# Altium schematic sheet 13_eMMC_Flash.SchDoc
size A3; SheetNumber: 10; SheetTotal: 21
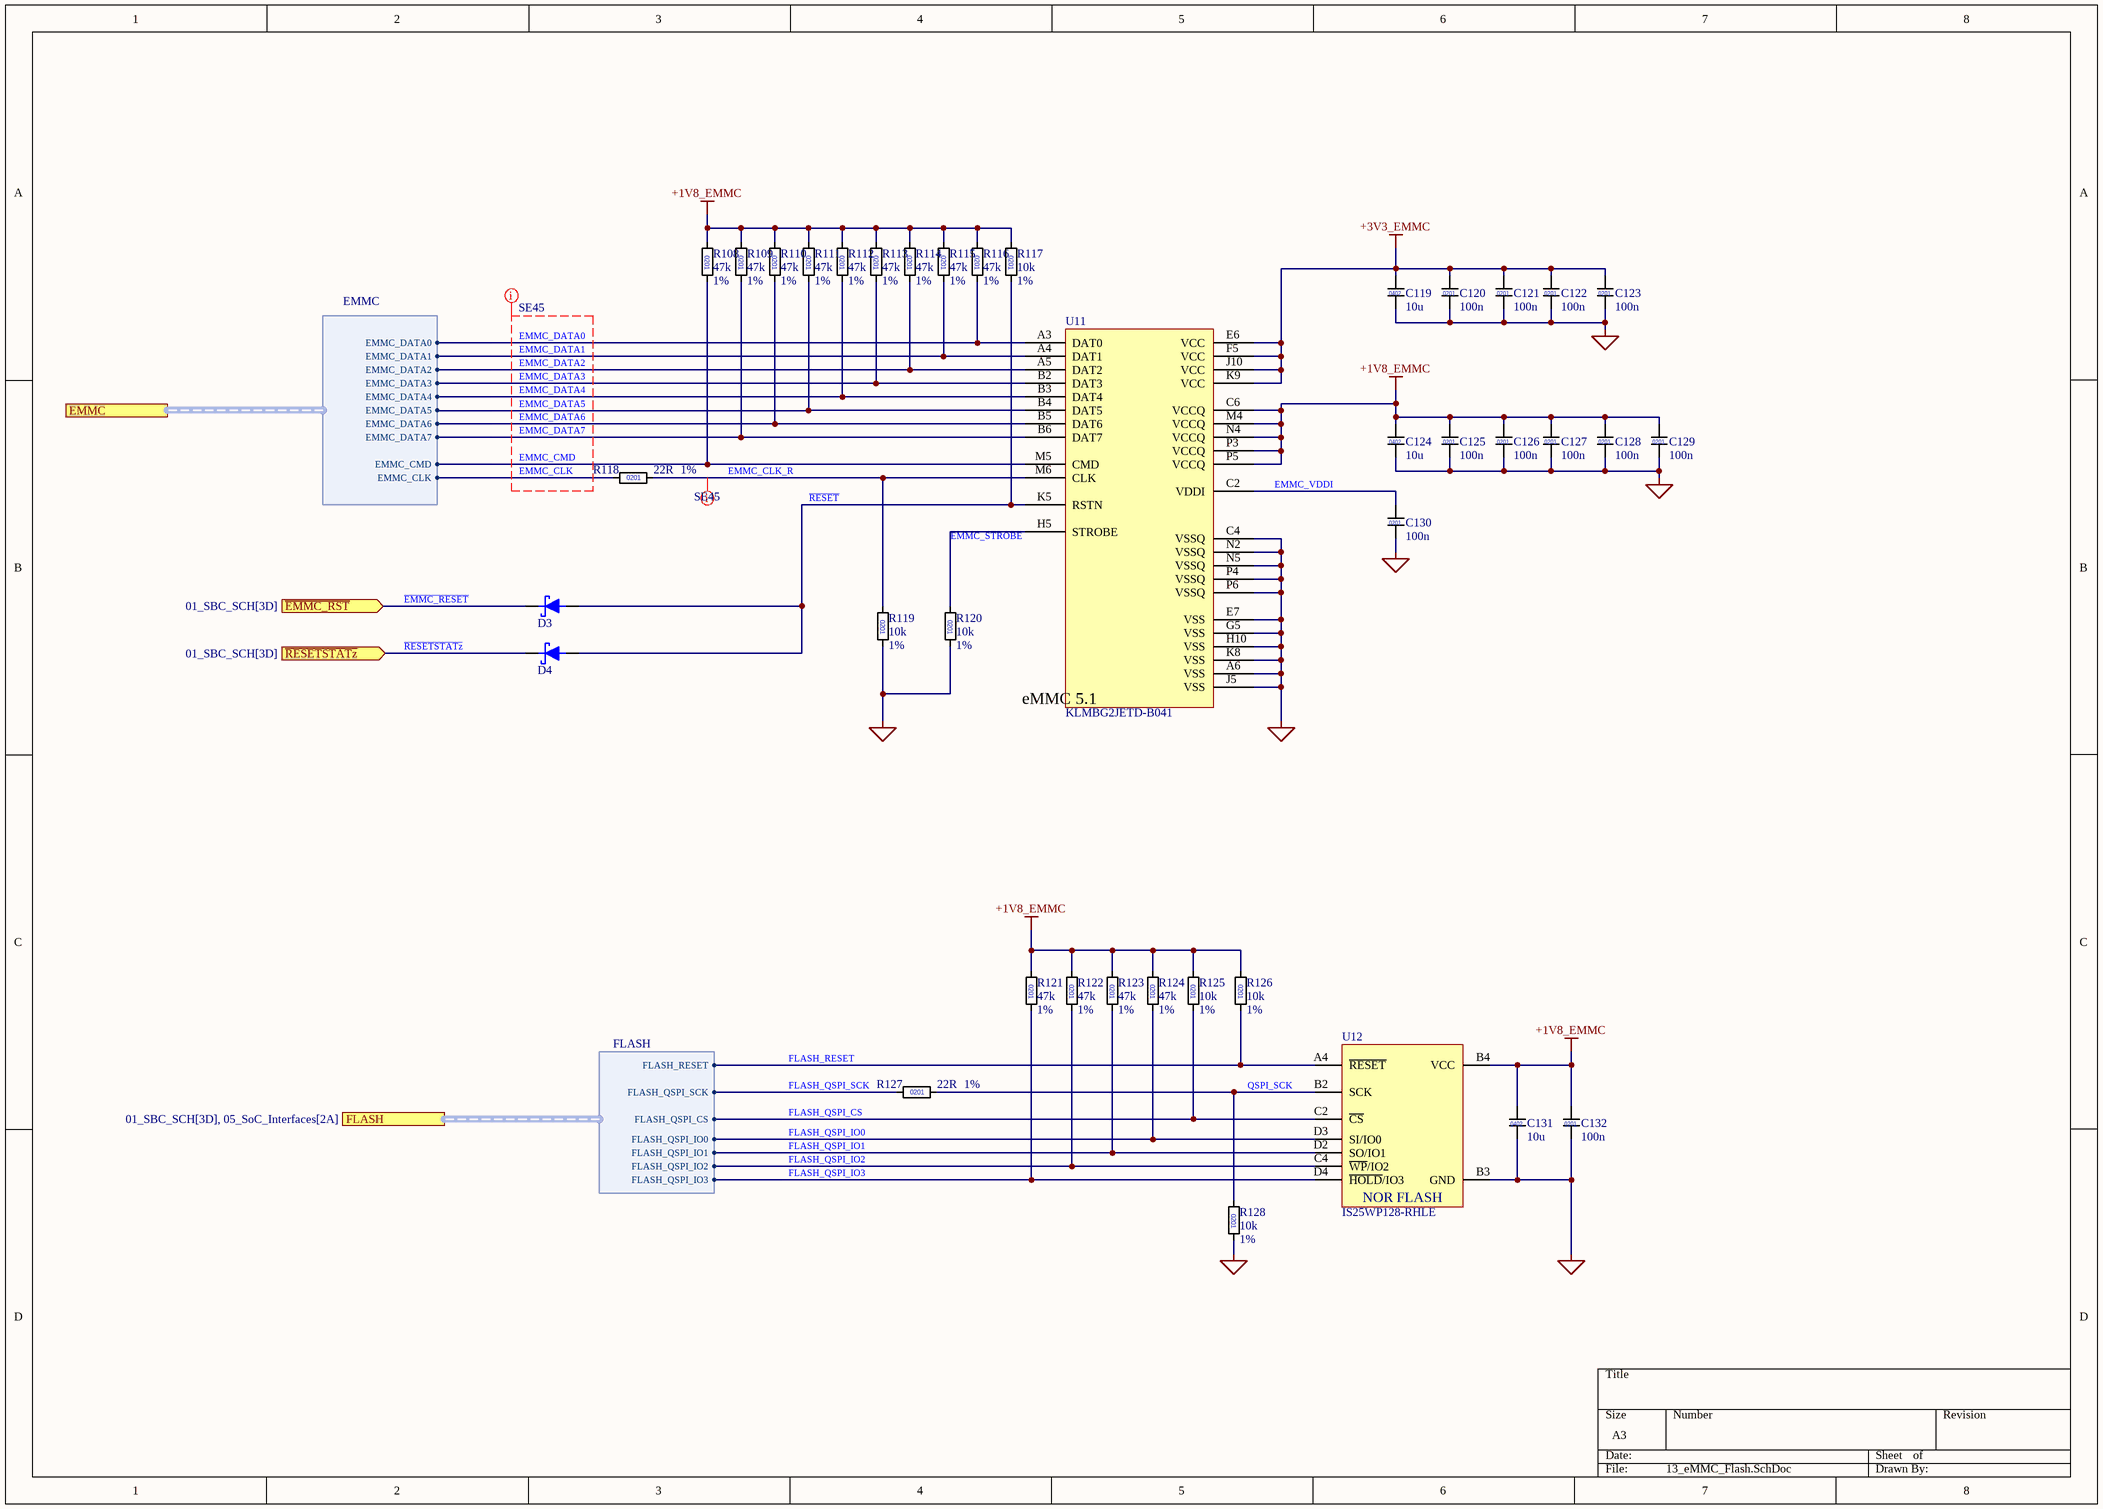
[diagram p0: 13_eMMC_Flash.SchDoc]

## Parts
C119  value 10u  [C0402]  (hidden comment: 4u7)
C120  value 100n  [C0201]  (hidden comment: C_0201)
C121  value 100n  [C0201]  (hidden comment: C_0201)
C122  value 100n  [C0201]  (hidden comment: C_0201)
C123  value 100n  [C0201]  (hidden comment: C_0201)
C124  value 10u  [C0402]  (hidden comment: 4u7)
C125  value 100n  [C0201]  (hidden comment: C_0201)
C126  value 100n  [C0201]  (hidden comment: C_0201)
C127  value 100n  [C0201]  (hidden comment: C_0201)
C128  value 100n  [C0201]  (hidden comment: C_0201)
C129  value 100n  [C0201]  (hidden comment: C_0201)
C130  value 100n  [C0201]  (hidden comment: C_0201)
C131  value 10u  [C0402]  (hidden comment: 4u7)
C132  value 100n  [C0201]  (hidden comment: C_0201)
D3  D_Filled  [D_SOD-523]  (value not drawn)
D4  D_Filled  [D_SOD-523]  (value not drawn)
R108  value 47k  Tolerance: 1%  [R0201]  (hidden comment: 0201)
R109  value 47k  Tolerance: 1%  [R0201]  (hidden comment: 0201)
R110  value 47k  Tolerance: 1%  [R0201]  (hidden comment: 0201)
R111  value 47k  Tolerance: 1%  [R0201]  (hidden comment: 0201)
R112  value 47k  Tolerance: 1%  [R0201]  (hidden comment: 0201)
R113  value 47k  Tolerance: 1%  [R0201]  (hidden comment: 0201)
R114  value 47k  Tolerance: 1%  [R0201]  (hidden comment: 0201)
R115  value 47k  Tolerance: 1%  [R0201]  (hidden comment: 0201)
R116  value 47k  Tolerance: 1%  [R0201]  (hidden comment: 0201)
R117  value 10k  Tolerance: 1%  [R0201]  (hidden comment: 0201)
R118  value 22R  Tolerance: 1%  [R0201]  (hidden comment: 0201)
R119  value 10k  Tolerance: 1%  [R0201]  (hidden comment: 0201)
R120  value 10k  Tolerance: 1%  [R0201]  (hidden comment: 0201)
R121  value 47k  Tolerance: 1%  [R0201]  (hidden comment: 0201)
R122  value 47k  Tolerance: 1%  [R0201]  (hidden comment: 0201)
R123  value 47k  Tolerance: 1%  [R0201]  (hidden comment: 0201)
R124  value 47k  Tolerance: 1%  [R0201]  (hidden comment: 0201)
R125  value 10k  Tolerance: 1%  [R0201]  (hidden comment: 0201)
R126  value 10k  Tolerance: 1%  [R0201]  (hidden comment: 0201)
R127  value 22R  Tolerance: 1%  [R0201]  (hidden comment: 0201)
R128  value 10k  Tolerance: 1%  [R0201]  (hidden comment: 0201)
U11  KLMBG2JETD-B041  [LFBGA-153_11.5x13mm_Layout14x14_P0.5mm]
U12  IS25WP128-RHLE  [IS25WP128-RHLE]

## Ports
EMMC (harness EMMC, see 01_SBC_SCH[3C], 05_SoC_Interfaces[7A]), FLASH (harness FLASH, see 01_SBC_SCH[3D], 05_SoC_Interfaces[2A]), ~{EMMC_RST} (in, see 01_SBC_SCH[3D]), ~{RESETSTATz} (in, see 01_SBC_SCH[3D])

## Harnesses
EMMC: EMMC_DATA0, EMMC_DATA1, EMMC_DATA2, EMMC_DATA3, EMMC_DATA4, EMMC_DATA5, EMMC_DATA6, EMMC_DATA7, EMMC_CMD, EMMC_CLK
FLASH: FLASH_QSPI_SCK, FLASH_QSPI_CS, FLASH_QSPI_IO0, FLASH_QSPI_IO1, FLASH_QSPI_IO2, FLASH_QSPI_IO3, FLASH_RESET

## Nets
+1V8_EMMC: C124.1 C125.1 C126.1 C127.1 C128.1 C129.1 C131.1 C132.1 R108.1 R109.1 R110.1 R111.1 R112.1 R113.1 R114.1 R115.1 R116.1 R117.1 R121.1 R122.1 R123.1 R124.1 R125.1 R126.1 U11.C6(VCCQ) U11.M4(VCCQ) U11.N4(VCCQ) U11.P3(VCCQ) U11.P5(VCCQ) U12.B4(VCC)
+3V3_EMMC: C119.1 C120.1 C121.1 C122.1 C123.1 U11.E6(VCC) U11.F5(VCC) U11.J10(VCC) U11.K9(VCC)
GND: C119.2 C120.2 C121.2 C122.2 C123.2 C124.2 C125.2 C126.2 C127.2 C128.2 C129.2 C130.2 C131.2 C132.2 R119.2 R120.2 R128.2 U11.A6(VSS) U11.C4(VSSQ) U11.E7(VSS) U11.G5(VSS) U11.H10(VSS) U11.J5(VSS) U11.K8(VSS) U11.N2(VSSQ) U11.N5(VSSQ) U11.P4(VSSQ) U11.P6(VSSQ) U12.B3(GND)
~{EMMC_RESET}: D3.1(K) ; port ~{EMMC_RST}
~{RESET}: D3.2(A) D4.2(A) R117.2 U11.K5(RSTN)
~{RESETSTATz}: D4.1(K) ; port ~{RESETSTATz}
EMMC_CLK: R118.1 ; port EMMC.EMMC_CLK
EMMC_CLK_R: R118.2 R119.1 U11.M6(CLK)
EMMC_CMD: R108.2 U11.M5(CMD) ; port EMMC.EMMC_CMD
EMMC_DATA0: R116.2 U11.A3(DAT0) ; port EMMC.EMMC_DATA0
EMMC_DATA1: R115.2 U11.A4(DAT1) ; port EMMC.EMMC_DATA1
EMMC_DATA2: R114.2 U11.A5(DAT2) ; port EMMC.EMMC_DATA2
EMMC_DATA3: R113.2 U11.B2(DAT3) ; port EMMC.EMMC_DATA3
EMMC_DATA4: R112.2 U11.B3(DAT4) ; port EMMC.EMMC_DATA4
EMMC_DATA5: R111.2 U11.B4(DAT5) ; port EMMC.EMMC_DATA5
EMMC_DATA6: R110.2 U11.B5(DAT6) ; port EMMC.EMMC_DATA6
EMMC_DATA7: R109.2 U11.B6(DAT7) ; port EMMC.EMMC_DATA7
EMMC_STROBE: R120.1 U11.H5(STROBE)
EMMC_VDDI: C130.1 U11.C2(VDDI)
FLASH_QSPI_CS: R125.2 U12.C2(~{CS}) ; port FLASH.FLASH_QSPI_CS
FLASH_QSPI_IO0: R124.2 U12.D3(SI/IO0) ; port FLASH.FLASH_QSPI_IO0
FLASH_QSPI_IO1: R123.2 U12.D2(SO/IO1) ; port FLASH.FLASH_QSPI_IO1
FLASH_QSPI_IO2: R122.2 U12.C4(~{WP}/IO2) ; port FLASH.FLASH_QSPI_IO2
FLASH_QSPI_IO3: R121.2 U12.D4(~{HOLD}/IO3) ; port FLASH.FLASH_QSPI_IO3
FLASH_QSPI_SCK: R127.1 ; port FLASH.FLASH_QSPI_SCK
FLASH_RESET: R126.2 U12.A4(~{RESET}) ; port FLASH.FLASH_RESET
QSPI_SCK: R127.2 R128.1 U12.B2(SCK)

## Layout directives
net class SE45: EMMC_CLK, EMMC_CLK_R, EMMC_CMD, EMMC_DATA0, EMMC_DATA1, EMMC_DATA2, EMMC_DATA3, EMMC_DATA4, EMMC_DATA5, EMMC_DATA6, EMMC_DATA7

## Notes on the sheet
- (in symbol C_0201) 0201
- (in symbol C_0402) 0402
- (in symbol IS25WP128-RHLE) NOR FLASH
- (in symbol KLMBG2JETD-B041) eMMC 5.1

## Library data of the parts
C119 C124 C131 = C_0402: MLCC 0402; Manufacturer_Name: *; Manufacturer_Part_Number: *
C120-C123 C125-C130 C132 = C_0201: MLCC 0201; Manufacturer_Name: *; Manufacturer_Part_Number: *
D3 D4 = D_Filled: Diode, filled shape; Manufacturer_Name: Panjit International Inc.; Value: BAT54TS_R1_00001; Manufacturer Part Number: BAT54TS_R1_00001
R108-R128 = R_0201: Manufacturer_Name: *; Manufacturer_Part_Number: *
U11 = KLMBG2JETD-B041: Samsung eMMC 5.1, 32GB, NAND flash + MMC controller, HS400 capable, FBGA-153; KiCad_Footprint: Package_BGA:Samsung_FBGA-153_11.5x13mm_Layout14x14_P0.5mm; Datasheet: https://www.lcsc.com/datasheet/C2803245.pdf; ComponentLink1Description: Datasheet; ComponentLink1URL: https://www.lcsc.com/datasheet/C2803245.pdf; Manufacturer_Name: *; Manufacturer_Part_Number: *
U12 = IS25WP128-RHLE: 128Mbit 1.65V~1.95V 133MHz SPI TFBGA-24(6x8) Memory RoHS; Manufacturer_Name: *; Manufacturer_Part_Number: *; Value: IS25WP128-RHLE